# Altium project PD_BQ_Ref_Design.PrjPcb (part 2 of 3)

## Sheet BQ25792.SchDoc
size A2; Date: Not shown in title block; ApprovedBy: Not shown in title block; CheckedBy: Not shown in title block; Author: Not shown in title block; CompanyName: Not shown in title block; Engineer: Not shown in title block; Organization: Not shown in title block; Address1: Not shown in title block; Address2: Not shown in title block; Address3: Not shown in title block; Address4: Not shown in title block; DocumentNumber: 2; Revision: Use project parameter SCH_Rev; SheetNumber: 2; SheetTotal: 3; PageSetup: Record=PageOptions|CenterHorizontal=True|CenterVertical=True|PrintScale=1.00|XCorrection=1.00|YCorrection=1.00|PrintKind=0|BorderSize=5000000|LeftOffset=0|BottomOffset=0|Orientation=2|PaperLength=1000|PaperWidth=1000|Scale=100|PaperSource=15|PrintQuality=600|MediaType=1|DitherType=10|PaperKind=Letter|PrintScaleMode=1; CurrentTime: Not shown in title block; CurrentDate: Not shown in title block; Time: Not shown in title block; DocumentFullPathAndName: Not shown in title block; DocumentName: Not shown in title block; ModifiedDate: Not shown in title block; ImagePath: Not shown in title block
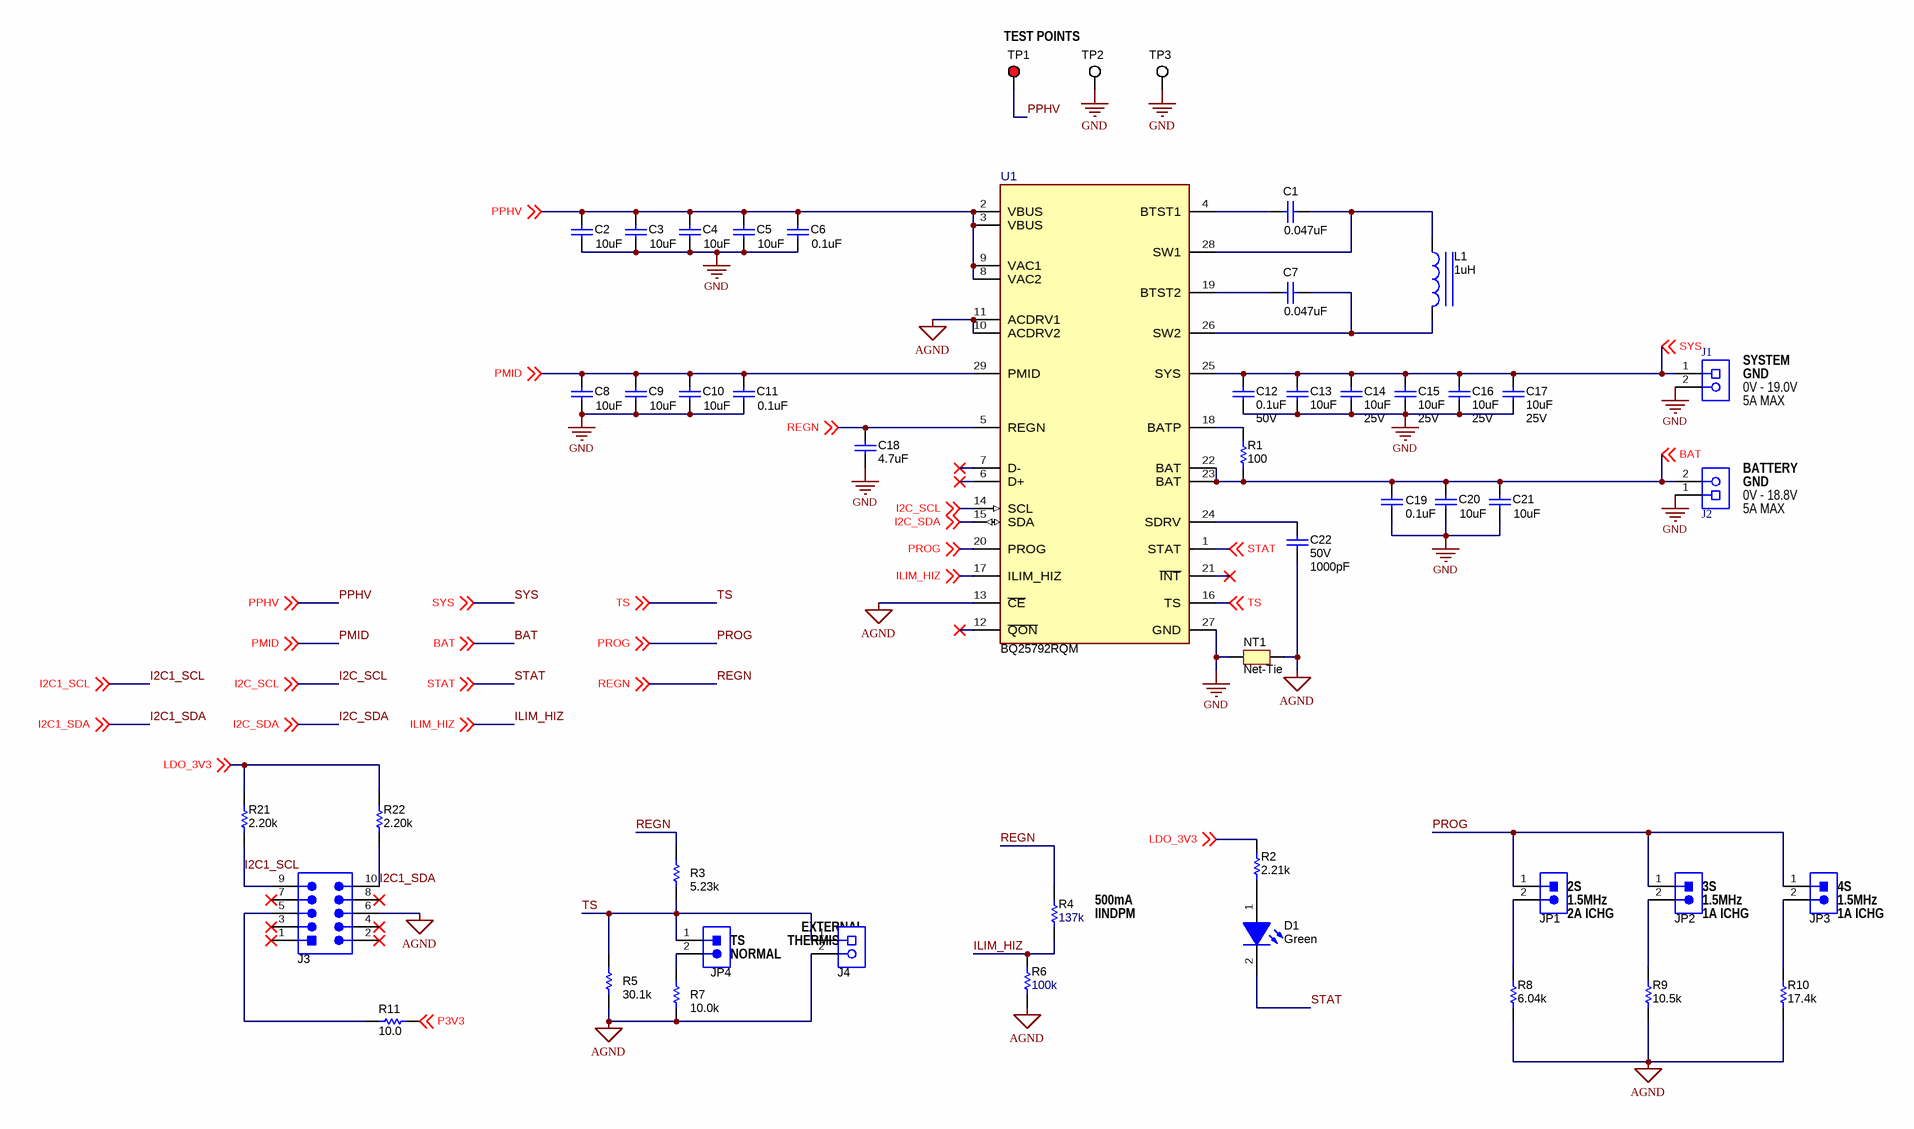
[diagram p3: BQ25792.SchDoc]

### Parts
C1  ValueDisplayed: 0.047uF  [0402]  (hidden comment: GRM155R71E473KA88D)
C2  ValueDisplayed: 10uF  [0603]  (hidden comment: GRT188R61E106ME13D)
C3  ValueDisplayed: 10uF  [0603]  (hidden comment: GRT188R61E106ME13D)
C4  ValueDisplayed: 10uF  [0603]  (hidden comment: GRT188R61E106ME13D)
C5  ValueDisplayed: 10uF  [0603]  (hidden comment: GRT188R61E106ME13D)
C6  ValueDisplayed: 0.1uF  [0402]  (hidden comment: C1005X7R1H104K050BE)
C7  ValueDisplayed: 0.047uF  [0402]  (hidden comment: GRM155R71E473KA88D)
C8  ValueDisplayed: 10uF  [0603]  (hidden comment: GRT188R61E106ME13D)
C9  ValueDisplayed: 10uF  [0603]  (hidden comment: GRT188R61E106ME13D)
C10  ValueDisplayed: 10uF  [0603]  (hidden comment: GRT188R61E106ME13D)
C11  ValueDisplayed: 0.1uF  [0402]  (hidden comment: C1005X7R1H104K050BE)
C12  ValueDisplayed: 0.1uF  VDC_V: 50V  [0402]  (hidden comment: C1005X7R1H104K050BE)
C13  ValueDisplayed: 10uF  [0805_HV]  (hidden comment: C2012X5R1E106K125AB)
C14  ValueDisplayed: 10uF  VDC_V: 25V  [0805_HV]  (hidden comment: C2012X5R1E106K125AB)
C15  ValueDisplayed: 10uF  VDC_V: 25V  [0805_HV]  (hidden comment: C2012X5R1E106K125AB)
C16  ValueDisplayed: 10uF  VDC_V: 25V  [0805_HV]  (hidden comment: C2012X5R1E106K125AB)
C17  ValueDisplayed: 10uF  VDC_V: 25V  [0805_HV]  (hidden comment: C2012X5R1E106K125AB)
C18  ValueDisplayed: 4.7uF  [0603]  (hidden comment: GRM188R61C475KAAJ)
C19  ValueDisplayed: 0.1uF  [0402L]  (hidden comment: C1005X7R1H104K050BE)
C20  ValueDisplayed: 10uF  [0603]  (hidden comment: GRT188R61E106ME13D)
C21  ValueDisplayed: 10uF  [0603]  (hidden comment: GRT188R61E106ME13D)
C22  VDC_V: 50V  ValueDisplayed: 1000pF  [0402]  (hidden comment: C0402C102K5RACTU)
D1  value Green  [LED_LTST-C190]  (hidden comment: LTST-C190GKT)
J1  ED120/2DS  [On-Shore_ED120_2DS]  (value not drawn)
J2  ED120/2DS  [On-Shore_ED120_2DS]  (value not drawn)
J3  N2510-6002-RB  [CONN_2510-6002]  (value not drawn)
J4  0393570002  [MOLEX_39357-0002]  (value not drawn)
JP1  Header_2x1  [CONN_PEC02SAAN]  (value not drawn)
JP2  Header_2x1  [CONN_PEC02SAAN]  (value not drawn)
JP3  Header_2x1  [CONN_PEC02SAAN]  (value not drawn)
JP4  Header_2x1  [CONN_PEC02SAAN]  (value not drawn)
L1  ValueDisplayed: 1uH  [IHLP-2020BZ]  (hidden comment: IHLP2020BZER1R0M11)
NT1  Net-Tie  [Net-Tie_20milWide_60milLong]  (net tie, no BOM)
R1  ValueDisplayed: 100  [0603]  (hidden comment: RC0603FR-07100RL)
R2  value 2.21k  [0402]  (hidden comment: CRCW04022K21FKED)
R3  value 5.23k  [0402]  (hidden comment: Resistor)
R4  ValueDisplayed: 137k  [0603]  (hidden comment: RC0603FR-07137KL)
R5  value 30.1k  [0402]  (hidden comment: Resistor)
R6  ValueDisplayed: 100k  [0603]  (hidden comment: RC0603FR-07100KL)
R7  value 10.0k  [0402]  (hidden comment: Resistor)
R8  ValueDisplayed: 6.04k  [0603]  (hidden comment: RC0603FR-076K04L)
R9  ValueDisplayed: 10.5k  [0603]  (hidden comment: CRCW060310K5FKEA)
R10  ValueDisplayed: 17.4k  [0603]  (hidden comment: CRCW060317K4FKEA)
R11  ValueDisplayed: 10.0  [1206]  (hidden comment: ERJ-8ENF10R0V)
R21  ValueDisplayed: 2.20k  [0201]  (hidden comment: CRCW02012K20FKED)
R22  ValueDisplayed: 2.20k  [0201]  (hidden comment: CRCW02012K20FKED)
TP1  5000  [Keystone5000]  (value not drawn)
TP2  5016  [Testpoint_Keystone_Compact]  (value not drawn)
TP3  5016  [Testpoint_Keystone_Compact]  (value not drawn)
U1  BQ25792RQM  [RQM0029A-MFG]

### Nets
AGND: C22.2 J3.6 J4.2 NT1.2 R5.1 R6.1 R7.1 R8.1 R9.1 R10.1 U1.10(ACDRV2) U1.11(ACDRV1) U1.13(~{CE})
GND: C2.1 C3.1 C4.1 C5.1 C6.2 C8.1 C9.1 C10.1 C11.2 C12.2 C13.2 C14.2 C15.2 C16.2 C17.2 C18.2 C19.2 C20.2 C21.2 J1.2 J2.1 NT1.1 TP2.1 TP3.1 U1.27(GND)
P3V3: R11.2 ; off-sheet P3V3
BAT: C19.1 C20.1 C21.1 J2.2 R1.1 U1.22(BAT) U1.23(BAT) ; off-sheet BAT
I2C1_SCL: J3.9 R21.1 ; off-sheet I2C1_SCL
I2C1_SDA: J3.10 R22.1 ; off-sheet I2C1_SDA
I2C_SCL: U1.14(SCL) ; off-sheet I2C_SCL
I2C_SDA: U1.15(SDA) ; off-sheet I2C_SDA
ILIM_HIZ: R4.1 R6.2 U1.17(ILIM_HIZ) ; off-sheet ILIM_HIZ
LDO_3V3: R2.2 R21.2 R22.2 ; off-sheet LDO_3V3
PMID: C8.2 C9.2 C10.2 C11.1 U1.29(PMID) ; off-sheet PMID
PPHV: C2.2 C3.2 C4.2 C5.2 C6.1 TP1.1 U1.2(VBUS) U1.3(VBUS) U1.8(VAC2) U1.9(VAC1) ; off-sheet PPHV
PROG: JP1.1 JP2.1 JP3.1 U1.20(PROG) ; off-sheet PROG
REGN: C18.1 R3.2 R4.2 U1.5(REGN) ; off-sheet REGN
STAT: D1.2(K) U1.1(STAT) ; off-sheet STAT
SYS: C12.1 C13.1 C14.1 C15.1 C16.1 C17.1 J1.1 U1.25(SYS) ; off-sheet SYS
TS: J4.1 JP4.1 R3.1 R5.2 U1.16(TS) ; off-sheet TS
NetC1_1: C1.1 U1.4(BTST1)
NetC1_2: C1.2 L1.1 U1.28(SW1)
NetC7_1: C7.1 U1.19(BTST2)
NetC7_2: C7.2 L1.2 U1.26(SW2)
NetC22_1: C22.1 U1.24(SDRV)
NetD1_1: D1.1(A) R2.1
NetJ3_5: J3.5 R11.1
NetJP1_2: JP1.2 R8.2
NetJP2_2: JP2.2 R9.2
NetJP3_2: JP3.2 R10.2
NetJP4_2: JP4.2 R7.2
NetR1_2: R1.2 U1.18(BATP)

Not connected (* = marked no-connect by the designer): J3 1* 2* 3* 4* 7* 8*; U1 6(D+)* 7(D-)* 12(~{QON})* 21(~{INT})*

### Notes on the sheet
- TEST POINTS
- (near J1) GND
- (near J1) 0V - 19.0V
- (near J1) 5A MAX
- (near J1) SYSTEM
- (near J2) BATTERY
- (near J2) GND
- (near J2) 0V - 18.8V
- (near J2) 5A MAX
- (near JP4) TS
- (near J4) EXTERNAL
- (near J4) THERMISTOR
- (near R4) 500mA
- (near R4) IINDPM
- (near JP1) 2S
- (near JP1) 1.5MHz
- (near JP1) 2A ICHG
- (near JP2) 3S
- (near JP2) 1.5MHz
- (near JP2) 1A ICHG
- (near JP3) 4S
- (near JP3) 1.5MHz
- (near JP3) 1A ICHG
- (near JP4) NORMAL
- (near J4) GND
- Orderable:
- Designed for:
- Mod. Date:
- Texas Instruments and/or its licensors do not warrant the accuracy or completeness of this specification or any information contained therein. Texas Instruments and/or its licensors do not warrant that this design will meet the specifications, will be suitable for your application or fit for any particular purpose, or will operate in an implementation. Texas Instruments and/or its licensors do not warrant that the design is production worthy. You should completely validate and test your design implementation to confirm the system functionality for your application.
- Drawn By:
- Engineer:
- SVN Rev:
- Number:
- TID #:
- Rev:
- Sheet Title:
- File:
- Contact:
- Project Title:
- Assembly Variant:
- Sheet:
- Size:
- of
- A2
- © Texas Instruments
- http://www.ti.com

### Library data of the parts
C1 C7 = CMP-0006669-2: CAP, CERM, 0.047 uF, 25 V, +/- 10%, X7R, 0402; Manufacturer: MuRata; TaMin_C: -55°C; Polarized: N; SizeAreaWB_mm2: 3; Value1: Unknown; U/M: EA; TaMax_C: 125°C; SizeZ_mm: 0.6; SizeX_mm: 1; SizeY_mm: 0.5; Value2: 25V; Cap_F: 47nF; AEC Category: Q200; Supplier Part Number 2: 14T3282; Publisher: Texas Instruments; Supplier 2: Newark; Supplier Part Number 3: 81-GRM155R71E473KA88; TempCo: X7R; Supplier 3: Mouser; Published: 2008-06-19; RoHS: Y; MountType: SMT; Value: 0.047uF; Supplier 1: Digi-Key; PackageReference: 0402; Tolerance_%: 10%; Cap_Case: 0402; SizeArea_mm2: 0.5; CompType: Capacitor; LatestRevisionDate: 2017-03-09; PartNumber: GRM155R71E473KA88D; AEC Qualified: ?; ComponentLink1Description: Datasheet link; Supplier Part Number 1: 490-3254-1-ND; Technology: Ceramic; ComponentLink1URL: http://search.murata.co.jp/Ceramy/PnsearchViewAction.do?HnOFG=ON&HnNFG=ON&SEL_CNT=50&sLang=en&sKey=GRM155R71E473KA88D&x=9&y=9&search=startwith
C2-C5 C8-C10 C20 C21 = CMP-0007501-5: CAP, CERM, 10 uF, 25 V, +/- 20%, X5R, 0603; Manufacturer: MuRata; TaMin_C: -55°C; Polarized: N; SizeAreaWB_mm2: 4.68; Value1: Unknown; U/M: EA; Value: 10uF; TaMax_C: 85°C; SizeZ_mm: 1; SizeX_mm: 1.6; SizeY_mm: 0.8; Value2: 25V; SizeArea_mm2: 1.28; Cap_F: 10µF; AEC Category: Q200; Supplier Part Number 2: 81-GRT188R61E106ME3D; Publisher: Texas Instruments; Supplier 2: Mouser; TempCo: X5R; Published: 2008-06-19; RoHS: Y; MountType: SMT; Supplier 1: Digi-Key; PackageReference: 0603; Tolerance_%: 20%; Cap_Case: 0603; CompType: Capacitor; LatestRevisionDate: 2017-03-09; PartNumber: GRT188R61E106ME13D; AEC Qualified: N; ComponentLink1Description: Datasheet link; AEC Grade: N/A; Supplier Part Number 1: 490-12323-1-ND; Technology: Ceramic; ComponentLink1URL: http://search.murata.co.jp/Ceramy/image/img/A01X/G101/ENG/GRT188R61E106ME13-01.pdf
C6 C11 = CMP-0064946-2: CAP, CERM, 0.1 uF, 50 V,+/- 10%, X7R, 0402; Manufacturer: TDK; TaMin_C: -55°C; Polarized: N; SizeAreaWB_mm2: 3; Value1: Unknown; U/M: EA; Value: 0.1uF; TaMax_C: 125°C; SizeZ_mm: 0.6; SizeX_mm: 1; SizeY_mm: 0.5; Value2: 50V; Cap_F: 100nF; AEC Category: Q200; Supplier Part Number 2: 92Y5763; Publisher: Texas Instruments; Supplier 2: Newark; Supplier Part Number 3: 810-C1005X7R1H104KBE; TempCo: X7R; Supplier 3: Mouser; Published: 2008-06-19; RoHS: Y; MountType: SMT; Supplier 1: Digi-Key; PackageReference: 0402; Tolerance_%: 10%; Cap_Case: 0402; SizeArea_mm2: 0.5; CompType: Capacitor; LatestRevisionDate: 2017-06-05; PartNumber: C1005X7R1H104K050BE; AEC Qualified: N; ComponentLink1Description: Datasheet link; AEC Grade: N/A; Supplier Part Number 1: 445-173610-1-ND; Technology: Ceramic; ComponentLink1URL: https://product.tdk.com/info/en/catalog/datasheets/mlcc_commercial_soft_en.pdf
C12 = CMP-0064946-2: CAP, CERM, 0.1 uF, 50 V,+/- 10%, X7R, 0402; Manufacturer: TDK; TaMin_C: -55°C; Polarized: N; SizeAreaWB_mm2: 3; Value1: Unknown; U/M: EA; Value: 0.1uF; TaMax_C: 125°C; SizeZ_mm: 0.6; SizeX_mm: 1; SizeY_mm: 0.5; Cap_F: 100nF; AEC Category: Q200; ComponentLink1URL: https://product.tdk.com/info/en/catalog/datasheets/mlcc_commercial_soft_en.pdf; Supplier Part Number 2: 92Y5763; Publisher: Texas Instruments; Supplier 2: Newark; Supplier Part Number 3: 810-C1005X7R1H104KBE; TempCo: X7R; Supplier 3: Mouser; Published: 2008-06-19; RoHS: Y; MountType: SMT; Supplier 1: Digi-Key; PackageReference: 0402; Tolerance_%: 10%; Cap_Case: 0402; Value2: 50V; SizeArea_mm2: 0.5; CompType: Capacitor; LatestRevisionDate: 2017-06-05; PartNumber: C1005X7R1H104K050BE; AEC Qualified: N; ComponentLink1Description: Datasheet link; AEC Grade: N/A; Supplier Part Number 1: 445-173610-1-ND; Technology: Ceramic
C13 = CMP-0007828-2: CAP, CERM, 10 uF, 25 V, +/- 10%, X5R, 0805; Manufacturer: TDK; TaMin_C: -55°C; Polarized: N; SizeAreaWB_mm2: 6.75; Value1: Unknown; U/M: EA; Value: 10uF; TaMax_C: 85°C; SizeZ_mm: 1.45; SizeX_mm: 2; SizeY_mm: 1.25; Cap_Case: 0805; Value2: 25V; SizeArea_mm2: 2.5; Cap_F: 10µF; AEC Category: Q200; ComponentLink1URL: http://www.tdk.com/pdf/TDKMLCCCapRange.pdf; Publisher: Texas Instruments; TempCo: X5R; Published: 2008-06-19; RoHS: Y; MountType: SMT; Supplier 1: Digi-Key; PackageReference: 0805; Tolerance_%: 10%; CompType: Capacitor; LatestRevisionDate: 2017-03-09; PartNumber: C2012X5R1E106K125AB; AEC Qualified: ?; ComponentLink1Description: Datasheet link; Supplier Part Number 1: 445-5984-1-ND; Technology: Ceramic; VDC_V: 25V
C14-C17 = CMP-0007828-2: CAP, CERM, 10 uF, 25 V, +/- 10%, X5R, 0805; Manufacturer: TDK; TaMin_C: -55°C; Polarized: N; SizeAreaWB_mm2: 6.75; Value1: Unknown; U/M: EA; Value: 10uF; TaMax_C: 85°C; SizeZ_mm: 1.45; SizeX_mm: 2; SizeY_mm: 1.25; Cap_Case: 0805; SizeArea_mm2: 2.5; Cap_F: 10µF; AEC Category: Q200; ComponentLink1URL: http://www.tdk.com/pdf/TDKMLCCCapRange.pdf; Publisher: Texas Instruments; TempCo: X5R; Published: 2008-06-19; RoHS: Y; MountType: SMT; Supplier 1: Digi-Key; PackageReference: 0805; Tolerance_%: 10%; Value2: 25V; CompType: Capacitor; LatestRevisionDate: 2017-03-09; PartNumber: C2012X5R1E106K125AB; AEC Qualified: ?; ComponentLink1Description: Datasheet link; Supplier Part Number 1: 445-5984-1-ND; Technology: Ceramic
C18 = CMP-0007341-5: CAP, CERM, 4.7 uF, 16 V, +/- 10%, X5R, 0603; Manufacturer: MuRata; TaMin_C: -55°C; Polarized: N; SizeAreaWB_mm2: 4.68; Value1: Unknown; U/M: EA; Value: 4.7uF; TaMax_C: 85°C; SizeZ_mm: 1; SizeX_mm: 1.6; SizeY_mm: 0.8; Value2: 16V; SizeArea_mm2: 1.28; Cap_F: 4.7µF; AEC Category: Q200; Supplier Part Number 2: 81-GRM188R61C475KAJD; Publisher: Texas Instruments; Supplier 2: Mouser; TempCo: X5R; Published: 2008-06-19; RoHS: Y; MountType: SMT; Supplier 1: Digi-Key; PackageReference: 0603; Tolerance_%: 10%; Cap_Case: 0603; CompType: Capacitor; LatestRevisionDate: 2017-03-09; PartNumber: GRM188R61C475KAAJ; AEC Qualified: N; ComponentLink1Description: Datasheet link; AEC Grade: N/A; Supplier Part Number 1: 490-10481-1-ND; Technology: Ceramic; ComponentLink1URL: http://psearch.murata.com/capacitor/product/GRM188R61C475KAAJ%23.pdf
C19 = CMP-0064946-2: CAP, CERM, 0.1 uF, 50 V,+/- 10%, X7R, 0402; Manufacturer: TDK; TaMin_C: -55°C; Polarized: N; SizeAreaWB_mm2: 3; Value1: Unknown; U/M: EA; Value: 0.1uF; TaMax_C: 125°C; SizeZ_mm: 0.6; SizeX_mm: 1; SizeY_mm: 0.5; Cap_Case: 0402; Value2: 50V; Cap_F: 100nF; AEC Category: Q200; Supplier Part Number 2: 92Y5763; Publisher: Texas Instruments; Supplier 2: Newark; Supplier Part Number 3: 810-C1005X7R1H104KBE; TempCo: X7R; Supplier 3: Mouser; Published: 2008-06-19; RoHS: Y; MountType: SMT; Supplier 1: Digi-Key; PackageReference: 0402; Tolerance_%: 10%; SizeArea_mm2: 0.5; CompType: Capacitor; LatestRevisionDate: 2017-06-05; PartNumber: C1005X7R1H104K050BE; AEC Qualified: N; VDC_V: 50V; ComponentLink1Description: Datasheet link; AEC Grade: N/A; Supplier Part Number 1: 445-173610-1-ND; Technology: Ceramic; ComponentLink1URL: https://product.tdk.com/info/en/catalog/datasheets/mlcc_commercial_soft_en.pdf
C22 = CMP-0006235-2: CAP, CERM, 1000 pF, 50 V, +/- 10%, X7R, 0402; Manufacturer: Kemet; TaMin_C: -55°C; Polarized: N; SizeAreaWB_mm2: 3; Value1: Unknown; U/M: EA; Value: 1000pF; TaMax_C: 125°C; SizeZ_mm: 0.6; SizeX_mm: 1; SizeY_mm: 0.5; Cap_F: 1nF; AEC Category: Q200; Supplier Part Number 2: 53M7151; Publisher: Texas Instruments; Supplier 2: Newark; Supplier Part Number 3: 80-C0402C102K5R; TempCo: X7R; Supplier 3: Mouser; Published: 2008-06-19; RoHS: Y; MountType: SMT; Supplier 1: Digi-Key; PackageReference: 0402; Tolerance_%: 10%; Cap_Case: 0402; Value2: 50V; SizeArea_mm2: 0.5; CompType: Capacitor; LatestRevisionDate: 2017-03-09; PartNumber: C0402C102K5RACTU; AEC Qualified: N; ComponentLink1Description: Datasheet link; AEC Grade: N/A; Supplier Part Number 1: 399-1032-1-ND; Technology: Ceramic; ComponentLink1URL: http://www.kemet.com/docfinder?Partnumber=C0402C102K5RACTU
D1 = CMP-0002827-3: LED, Green, SMD; Manufacturer: Lite-On; Vf_V: 2.1V; Io_A: 20mA; Power_TotalModule: 100mW; Value1: 0.1W; CompType: LED; PartNumber: LTST-C190GKT; MountType: SMT; RoHS: Y; PackageReference: 1.6x0.8x0.8mm; Type: ?; Value2: 2.1V; Color: green; ComponentLink1URL: https://sps06.itg.ti.com/sites/KMS/crossdivteams/altium/docs/ComponentDatasheets/LTST-C190GKT.pdf; ComponentLink1Description: Datasheet link
J1 J2 = CMP-0074910-1: Terminal Block, 5.08 mm, 2x1, Brass, TH; Manufacturer: On-Shore Technology; Cert_VDE: Y; CNHeader: False; Current_A: 15A; Green_Lifecycle: Not Set; Shrouded: N; Gender: Female; Green_REACh: Incomplete; Voltage_V: 300V; Row_Count: 1; Pitch_mm: 5.08; CT: True; ComponentLink1URL: http://www.on-shore.com/sites/default/files/manuals/ed120ds.pdf; Publisher: Texas Instruments; Color: Blue; Cert_CULUS: Y; RoHS: Y; MountType: TH; Green_EU RoHS-2: Incomplete; Supplier 1: Digi-Key; Green_EU RoHS: Incomplete; PackageReference: 2x1 5.08 mm Terminal Block; PinCount: 2; CompType: Terminal Block; LatestRevisionDate: 2017-07-12; PartNumber: ED120/2DS; Orientation: Vertical; ComponentLink1Description: Datasheet URL; Supplier Part Number 1: ED1609-ND; ContactFinish: Brass
J3 = CMP-0055448-2: Header (shrouded), 100mil, 5x2, High-Temperature, Gold, TH; Manufacturer: 3M; Green_Lifecycle: Active; Green_REACh: Passed; ComponentLink1URL: http://multimedia.3m.com/mws/mediawebserver?mwsId=66666UF6EVsSyXTtMXM6MxfcEVtQEVs6EVs6EVs6E666666--&fn=ts0770.pdf; Supplier Part Number 2: 18M6808; Supplier 2: Newark; Supplier Part Number 3: 517-N2510-6002RB; Supplier 3: Mouser; RoHS: Y; MountType: TH; Green_EU RoHS-2: Incomplete; Supplier 1: Digi-Key; Green_EU RoHS: Passed; PackageReference: 5x2 Shrouded header; CompType: Header; PartNumber: N2510-6002-RB; ComponentLink1Description: Datasheet URL; Supplier Part Number 1: MHC10K-ND
J4 = CMP-0055341-2: Terminal Block, 3.5 mm, 2x1, Tin, TH; Manufacturer: Molex; CNHeader: FALSE; CT: TRUE; Green_Lifecycle: Not Set; Green_REACh: Incomplete; Supplier Part Number 3: 538-39357-0002; PartNumber: 0393570002; Green_EU RoHS: Incomplete; Supplier Part Number 1: WM7877-ND; MountType: TH; Supplier 1: Digi-Key; Supplier 2: Newark; Green_EU RoHS-2: Incomplete; PackageReference: Terminal Block, 3.5 mm, 2x1, TH; CompType: Terminal Block; LatestRevisionDate: 26/05/2017; Publisher: Texas Instruments; ComponentLink1URL: http://www.molex.com/pdm_docs/sd/393570002_sd.pdf; Supplier Part Number 2: 72K2104; RoHS: Y; Supplier 3: Mouser; ComponentLink1Description: Datasheet URL
JP1-JP4 = CMP-0002337-1: Header, 100mil, 2x1, Tin, TH; PartNumber: PEC02SAAN; Manufacturer: Sullins Connector Solutions; Pitch_mm: 2.54; Gender: Male; Shrouded: N; Row_Count: 1; Current_A: 3A; Voltage_V: 1.8kV; Cert_UL: Y; CNHeader: TRUE; CT: FALSE; Green_Lifecycle: Not Set; Green_REACh: Incomplete; PackageReference: Header, 2 PIN, 100mil, Tin; CompType: Header; RoHS: Y; MountType: TH; ComponentLink1Description: Datasheet URL; ComponentLink1URL: http://www.sullinscorp.com/catalogs/77_PAGE108-109_.100_MALE_HDR.pdf; Publisher: Texas Instruments; LatestRevisionDate: 26/05/2017; Supplier 1: Digi-Key; Supplier Part Number 1: S1012E-02-ND; ClassName: Header; Orientation: Vertical; PinCount: 2; ContactFinish: Tin; Color: Black; Green_EU RoHS-2: Incomplete; Green_EU RoHS: Incomplete
L1 = CMP-0063290-1: Inductor, Shielded Drum Core, Powdered Iron, 1 uH, 7 A, 0.0181 ohm, SMD; Manufacturer: Vishay-Dale; Isat: 7A @ 20% inductance drop; Irms: 7.5A @ 40C rise; Green_Lifecycle: Active; SizeAreaWB_mm2: 53.7782; DCR_ohm: 0.0181; Green_REACh: Passed; Value: 1uH; Imax_A: 7A; SizeZ_mm: 2; SizeX_mm: 5.49; SizeY_mm: 5.18; SizeArea_mm2: 28.4382; Ind_H: 1µH; AEC Category: Q200; ComponentLink1URL: http://www.vishay.com/docs/34261/lp20bz11.pdf; Publisher: Texas Instruments; Published: 2008-06-26; RoHS: Y; Value1: 0.0181 ohm; Material: Powdered Iron; MountType: SMT; Green_EU RoHS-2: Passed; Supplier 1: Digi-Key; Green_EU RoHS: Passed; PackageReference: 5.49x2x5.18mm; Value2: 7A; CompType: Inductor; LatestRevisionDate: 2017-06-02; PartNumber: IHLP2020BZER1R0M11; AEC Qualified: ?; ComponentLink1Description: Datasheet link; Supplier Part Number 1: 541-1218-1-ND; Technology: Shielded Drum Core
NT1 = CMP-0078142-3: Single point connection between nets.; MountType: SMT; CompType: Net-Tie; Manufacturer: N/A; PackageReference: N/A; PartNumber: N/A; Library Reference: Net-Tie
R1 = CMP-0022736-4: RES, 100, 1%, 0.1 W, 0603; Manufacturer: Yageo; Power_W: 100mW; TempCo: 100 ppm/C; Value_Code: 100R; Value: 100; EIA_Code: E96; SizeX_mm: 1.6; SizeY_mm: 0.8; SizeZ_mm: 1; Value2: 0.1W; SizeArea_mm2: 1.28; AEC Qualified: N; VDC_V: 75V; AEC Category: Q200; SizeAreaWB_mm2: 4.68; ComponentLink1URL: http://www.yageo.com/pdf/Pu-RC0603_51_PbFree_L_2.pdf; Supplier Part Number 2: 603-RC0603FR-07100RL; Supplier 2: Mouser; Supplier Part Number 3: 9238360; Supplier 3: Farnell; RoHS: Y; Value1: 1%; MountType: SMT; Supplier 1: Digi-Key; PackageReference: 0603; Tolerance_%: 1%; Res_ohm: 100; CompType: Resistor; PartNumber: RC0603FR-07100RL; ComponentLink1Description: Datasheet link; Supplier Part Number 1: 311-100HRCT-ND; Technology: Thick Film; AEC Grade: N/A
R2 = CMP-0026232-2: RES, 2.21 k, 1%, 0.063 W, AEC-Q200 Grade 0, 0402; Manufacturer: Vishay-Dale; Value_Code: 2k21; Power_W: 63mW; Value2: 0.063W; VDC_V: 50V; TempCo: 100 ppm/C; EIA_Code: E96; AEC Category: Q200; AEC Grade: 0; AEC Qualified: Y; SizeArea_mm2: 0.5; SizeX_mm: 1; SizeZ_mm: 0.6; CompType: Resistor; PartNumber: CRCW04022K21FKED; PackageReference: 0402; RoHS: E; Res_ohm: 2.21k; Tolerance_%: 1%; Value1: 1%; MountType: SMT; Technology: Thick Film; ComponentLink1Description: Datasheet link; ComponentLink1URL: http://www.vishay.com/docs/20035/dcrcwe3.pdf; Supplier 1: Digi-Key; Supplier Part Number 1: 541-2.21KLCT-ND; Supplier 2: Newark; Supplier Part Number 2: 52K6795; Supplier 3: Mouser; Supplier Part Number 3: 71-CRCW0402-2.21K-E3; SizeY_mm: 0.5; ValueDisplayed: 2.21k
R3 = CMP-0026464-2: RES, 5.23 k, 1%, 0.063 W, AEC-Q200 Grade 0, 0402; PartNumber: CRCW04025K23FKED; Manufacturer: Vishay-Dale; Value_Code: 5k23; Power_W: 63mW; Value2: 0.063W; VDC_V: 50V; TempCo: 100 ppm/C; EIA_Code: E96; AEC Category: Q200; AEC Qualified: Y; AEC Grade: 0; SizeArea_mm2: 0.5; SizeX_mm: 1; SizeZ_mm: 0.6; CompType: Resistor; PackageReference: 0402; RoHS: E; Res_ohm: 5.23k; Tolerance_%: 1%; Value1: 1%; MountType: SMT; Technology: Thick Film; ComponentLink1Description: Datasheet link; ComponentLink1URL: http://www.vishay.com/docs/20035/dcrcwe3.pdf; Supplier 1: Digi-Key; Supplier Part Number 1: 541-5.23KLCT-ND; Supplier 2: Newark; Supplier Part Number 2: 52K7121; Supplier 3: Mouser; Supplier Part Number 3: 71-CRCW0402-5.23K-E3; ValueDisplayed: 5.23k; SizeY_mm: 0.5
R4 = CMP-0022788-4: RES, 137 k, 1%, 0.1 W, 0603; Manufacturer: Yageo; Power_W: 100mW; TempCo: 100 ppm/C; Value: 137k; EIA_Code: E96; SizeX_mm: 1.6; SizeY_mm: 0.8; SizeZ_mm: 1; Value2: 0.1W; SizeArea_mm2: 1.28; AEC Qualified: N; VDC_V: 75V; AEC Category: Q200; SizeAreaWB_mm2: 4.68; ComponentLink1URL: http://www.yageo.com/pdf/Pu-RC0603_51_PbFree_L_2.pdf; Supplier Part Number 2: 603-RC0603FR-07137KL; Supplier 2: Mouser; Supplier Part Number 3: 1799325; Supplier 3: Farnell; Value_Code: 137k; RoHS: Y; Value1: 1%; MountType: SMT; Supplier 1: Digi-Key; PackageReference: 0603; Tolerance_%: 1%; Res_ohm: 137k; CompType: Resistor; PartNumber: RC0603FR-07137KL; ComponentLink1Description: Datasheet link; Supplier Part Number 1: 311-137KHRCT-ND; Technology: Thick Film; AEC Grade: N/A
R5 = CMP-0026284-2: RES, 30.1 k, 1%, 0.063 W, AEC-Q200 Grade 0, 0402; PartNumber: CRCW040230K1FKED; Manufacturer: Vishay-Dale; Value_Code: 30k1; Power_W: 63mW; Value2: 0.063W; VDC_V: 50V; TempCo: 100 ppm/C; EIA_Code: E96; AEC Category: Q200; AEC Qualified: Y; AEC Grade: 0; SizeArea_mm2: 0.5; SizeX_mm: 1; SizeZ_mm: 0.6; CompType: Resistor; PackageReference: 0402; RoHS: E; Res_ohm: 30.1k; Tolerance_%: 1%; Value1: 1%; MountType: SMT; Technology: Thick Film; ComponentLink1Description: Datasheet link; ComponentLink1URL: http://www.vishay.com/docs/20035/dcrcwe3.pdf; Supplier 1: Digi-Key; Supplier Part Number 1: 541-30.1KLCT-ND; Supplier 2: Newark; Supplier Part Number 2: 52K6954; Supplier 3: Mouser; Supplier Part Number 3: 71-CRCW0402-30.1K-E3; ValueDisplayed: 30.1k; SizeY_mm: 0.5
R6 = CMP-0022735-5: RES, 100 k, 1%, 0.1 W, 0603; Manufacturer: Yageo; Power_W: 100mW; TempCo: 100 ppm/C; Value: 100k; EIA_Code: E96; SizeX_mm: 1.6; SizeY_mm: 0.8; SizeZ_mm: 1; Value2: 0.1W; SizeArea_mm2: 1.28; AEC Qualified: N; VDC_V: 75V; AEC Category: Q200; SizeAreaWB_mm2: 4.68; Supplier Part Number 2: 603-RC0603FR-07100KL; Supplier 2: Mouser; Supplier Part Number 3: 9238727; Supplier 3: Farnell; Value_Code: 100k; RoHS: Y; Value1: 1%; MountType: SMT; Supplier 1: Digi-Key; PackageReference: 0603; Tolerance_%: 1%; Res_ohm: 100k; CompType: Resistor; PartNumber: RC0603FR-07100KL; ComponentLink1Description: Datasheet link; Supplier Part Number 1: 311-100KHRCT-ND; Technology: Thick Film; ComponentLink1URL: http://www.yageo.com/pdf/Pu-RC0603_51_PbFree_L_2.pdf; AEC Grade: N/A
R7 = CMP-0025958-3: RES, 10.0 k, 1%, 0.063 W, AEC-Q200 Grade 0, 0402; PartNumber: CRCW040210K0FKED; Manufacturer: Vishay-Dale; Res_ohm: 10k; Value_Code: 10k0; Power_W: 63mW; Value2: 0.063W; VDC_V: 50V; TempCo: 100 ppm/C; EIA_Code: E96; AEC Category: Q200; AEC Qualified: Y; AEC Grade: 0; SizeArea_mm2: 0.5; SizeX_mm: 1; SizeZ_mm: 0.6; CompType: Resistor; PackageReference: 0402; RoHS: E; Tolerance_%: 1%; Value1: 1%; MountType: SMT; Technology: Thick Film; ComponentLink1Description: Datasheet link; ComponentLink1URL: http://www.vishay.com/docs/20035/dcrcwe3.pdf; Supplier 1: Digi-Key; Supplier Part Number 1: 541-10.0KLCT-ND; Supplier 2: Newark; Supplier Part Number 2: 52K6595; Supplier 3: Mouser; Supplier Part Number 3: 71-CRCW0402-10K-E3; ValueDisplayed: 10.0k; SizeY_mm: 0.5
R8 = CMP-0023246-5: RES, 6.04 k, 1%, 0.1 W, 0603; Manufacturer: Yageo; Power_W: 100mW; TempCo: 100 ppm/C; Value_Code: 6k04; Value: 6.04k; EIA_Code: E96; SizeX_mm: 1.6; SizeY_mm: 0.8; SizeZ_mm: 1; Value2: 0.1W; SizeArea_mm2: 1.28; AEC Qualified: N; VDC_V: 75V; AEC Category: Q200; SizeAreaWB_mm2: 4.68; Supplier Part Number 2: 603-RC0603FR-076K04L; Supplier 2: Mouser; Supplier Part Number 3: 9238581; Supplier 3: Farnell; RoHS: Y; Value1: 1%; MountType: SMT; Supplier 1: Digi-Key; PackageReference: 0603; Tolerance_%: 1%; Res_ohm: 6.04k; CompType: Resistor; PartNumber: RC0603FR-076K04L; ComponentLink1Description: Datasheet link; Supplier Part Number 1: 311-6.04KHRCT-ND; Technology: Thick Film; ComponentLink1URL: http://www.yageo.com/pdf/Pu-RC0603_51_PbFree_L_2.pdf; AEC Grade: N/A
R9 = CMP-0022000-4: RES, 10.5 k, 1%, 0.1 W, AEC-Q200 Grade 0, 0603; Manufacturer: Vishay-Dale; Power_W: 100mW; TempCo: 100 ppm/C; Value_Code: 10k5; Value: 10.5k; EIA_Code: E96; SizeX_mm: 1.6; SizeY_mm: 0.8; SizeZ_mm: 1; Value2: 0.1W; SizeArea_mm2: 1.28; AEC Qualified: Y; VDC_V: 75V; AEC Category: Q200; AEC Grade: 0; Supplier Part Number 2: 52K8068; Supplier 2: Newark; Supplier Part Number 3: 71-CRCW0603-10.5K-E3; Supplier 3: Mouser; RoHS: E; Value1: 1%; MountType: SMT; Supplier 1: Digi-Key; PackageReference: 0603; Tolerance_%: 1%; Res_ohm: 10.5k; CompType: Resistor; PartNumber: CRCW060310K5FKEA; ComponentLink1Description: Datasheet link; Supplier Part Number 1: 541-10.5KHCT-ND; Technology: Thick Film; ComponentLink1URL: http://www.vishay.com/docs/20035/dcrcwe3.pdf
R10 = CMP-0022089-4: RES, 17.4 k, 1%, 0.1 W, AEC-Q200 Grade 0, 0603; Manufacturer: Vishay-Dale; Power_W: 100mW; TempCo: 100 ppm/C; Value_Code: 17k4; Value: 17.4k; EIA_Code: E96; SizeX_mm: 1.6; SizeY_mm: 0.8; SizeZ_mm: 1; Value2: 0.1W; SizeArea_mm2: 1.28; AEC Qualified: Y; VDC_V: 75V; AEC Category: Q200; AEC Grade: 0; Supplier Part Number 2: 52K8186; Supplier 2: Newark; Supplier Part Number 3: 71-CRCW0603-17.4K-E3; Supplier 3: Mouser; RoHS: E; Value1: 1%; MountType: SMT; Supplier 1: Digi-Key; PackageReference: 0603; Tolerance_%: 1%; Res_ohm: 17.4k; CompType: Resistor; PartNumber: CRCW060317K4FKEA; ComponentLink1Description: Datasheet link; Supplier Part Number 1: 541-17.4KHCT-ND; Technology: Thick Film; ComponentLink1URL: http://www.vishay.com/docs/20035/dcrcwe3.pdf
R11 = CMP-0017299-3: RES, 10.0, 1%, 0.25 W, AEC-Q200 Grade 0, 1206; Manufacturer: Panasonic; Power_W: 250mW; TempCo: 100 ppm/C; Value_Code: 10R0; Value: 10.0; EIA_Code: E96; Res_ohm: 10; SizeX_mm: 3.2; SizeY_mm: 1.6; SizeZ_mm: 1.35; Value2: 0.25W; SizeArea_mm2: 5.12; AEC Qualified: Y; VDC_V: 200V; AEC Category: Q200; AEC Grade: 0; SizeAreaWB_mm2: 10.92; Supplier Part Number 2: 1748406; Supplier 2: Farnell; RoHS: Y; Value1: 1%; MountType: SMT; Supplier 1: Digi-Key; PackageReference: 1206; Tolerance_%: 1%; CompType: Resistor; PartNumber: ERJ-8ENF10R0V; ComponentLink1Description: Datasheet link; Supplier Part Number 1: P10.0FCT-ND; Technology: Thick Film; ComponentLink1URL: https://industrial.panasonic.com/cdbs/www-data/pdf/RDA0000/AOA0000C304.pdf
R21 R22 = CMP-0027272-3: RES, 2.20 k, 1%, 0.05 W, 0201; Manufacturer: Vishay-Dale; Power_W: 50mW; TempCo: 100 ppm/C; Value_Code: 2k20; Value: 2.20k; Res_ohm: 2.2k; SizeX_mm: 0.6; SizeY_mm: 0.3; SizeZ_mm: 0.26; Value2: 0.05W; SizeArea_mm2: 0.18; AEC Qualified: N; VDC_V: 30V; AEC Category: Q200; Supplier Part Number 2: 01X1849; Supplier 2: Newark; Supplier Part Number 3: 71-CRCW02012K20FKED; Supplier 3: Mouser; RoHS: E; Value1: 1%; MountType: SMT; Supplier 1: Digi-Key; PackageReference: 0201; Tolerance_%: 1%; CompType: Resistor; PartNumber: CRCW02012K20FKED; ComponentLink1Description: Datasheet link; AEC Grade: N/A; Supplier Part Number 1: 541-2.20KAABCT-ND; Technology: Thick Film; ComponentLink1URL: http://www.vishay.com/docs/20052/crcw0201e3.pdf
TP1 = CMP-0055137-1: Test Point, Miniature, Red, TH; Manufacturer: Keystone; CNHeader: FALSE; ContactFinish: Silver; CT: TRUE; Green_Lifecycle: Active; Green_REACh: Passed; PartNumber: 5000; PackageReference: Red Miniature Testpoint; CompType: Test Point; RoHS: Y; MountType: TH; ComponentLink1Description: Datasheet URL; ComponentLink1URL: http://www.keyelco.com/userAssets/file/M60-2p60.pdf; Publisher: Texas Instruments; LatestRevisionDate: 26/05/2017; Supplier 1: Digi-Key; Supplier Part Number 1: 36-5000-ND; Supplier 2: Mouser; Supplier Part Number 2: 534-5000; Color: Red; Green_EU RoHS-2: Incomplete; Green_EU RoHS: Passed
TP2 TP3 = CMP-0055153-1: Test Point, Compact, SMT; Manufacturer: Keystone; CNHeader: FALSE; CT: TRUE; Green_Lifecycle: Active; Green_REACh: Passed; PartNumber: 5016; PackageReference: Testpoint_Keystone_Compact; CompType: Test Point; RoHS: Y; MountType: SMT; ComponentLink1Description: Datasheet URL; ComponentLink1URL: http://www.keyelco.com/userAssets/store/files/5016.PDF; Publisher: Texas Instruments; LatestRevisionDate: 26/05/2017; Supplier 1: Digi-Key; Supplier Part Number 1: 36-5016TR-ND; Supplier 2: Mouser; Supplier Part Number 2: 534-5016; Green_EU RoHS-2: Incomplete; Green_EU RoHS: Passed
U1 = CMP-0088656-1: BQ2579x HotRod; Manufacturer: Texas Instruments; SizeZ_mm: 1mm; Standoff Height: 0mm; helpURL: https://upverter.com/upn/revision/94d0648e55e6c5c0/; PartNumber: BQ25792RQM; Operating Temperature Range: to; Part Number: BQ25792RQM; Datasheet Path: datasheets/IC-BQ25792RQM.pdf; PackageReference: VQFN-HR29; RoHS: UNKNOWN

## Sheet Type_C_Port.SchDoc
size A2; Date: Not shown in title block; ApprovedBy: Not shown in title block; CheckedBy: Not shown in title block; Author: Not shown in title block; CompanyName: Not shown in title block; Engineer: Not shown in title block; Organization: Not shown in title block; Address1: Not shown in title block; Address2: Not shown in title block; Address3: Not shown in title block; Address4: Not shown in title block; DocumentNumber: 2; Revision: Use project parameter SCH_Rev; SheetNumber: 2; SheetTotal: 3; PageSetup: Record=PageOptions|CenterHorizontal=True|CenterVertical=True|PrintScale=1.00|XCorrection=1.00|YCorrection=1.00|PrintKind=0|BorderSize=5000000|LeftOffset=0|BottomOffset=0|Orientation=2|PaperLength=1000|PaperWidth=1000|Scale=100|PaperSource=15|PrintQuality=600|MediaType=1|DitherType=10|PaperKind=Letter|PrintScaleMode=1; CurrentTime: Not shown in title block; CurrentDate: Not shown in title block; Time: Not shown in title block; DocumentFullPathAndName: Not shown in title block; DocumentName: Not shown in title block; ModifiedDate: Not shown in title block; ImagePath: Not shown in title block
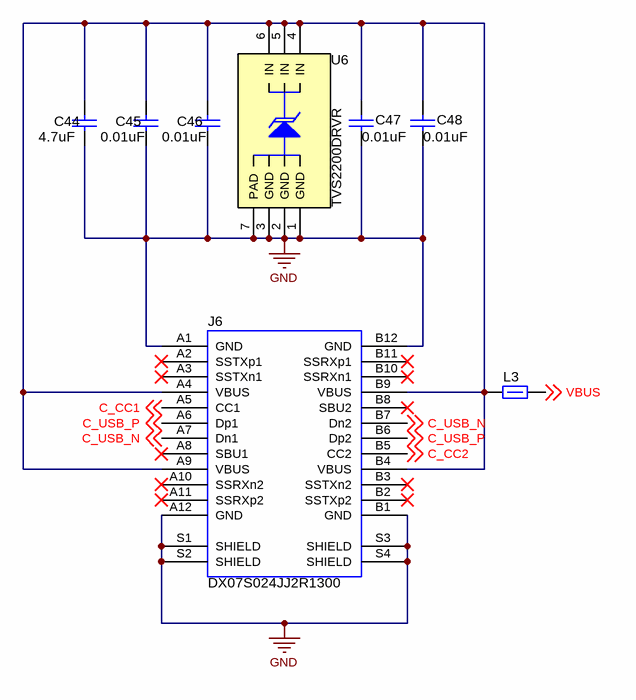
[diagram p4: Type_C_Port.SchDoc]

### Parts
C44  ValueDisplayed: 4.7uF  [0603]  (hidden comment: GRM188R6YA475KE15D)
C45  ValueDisplayed: 0.01uF  [0402]  (hidden comment: C0402C103J5RACTU)
C46  ValueDisplayed: 0.01uF  [0402]  (hidden comment: C0402C103J5RACTU)
C47  ValueDisplayed: 0.01uF  [0402]  (hidden comment: C0402C103J5RACTU)
C48  ValueDisplayed: 0.01uF  [0402]  (hidden comment: C0402C103J5RACTU)
J6  DX07S024JJ2R1300  [JAE_DX07S024JJ2R1300]
L3  FBMJ2125HM210NT  [0805_HV]  (value not drawn)
U6  TVS2200DRVR  [DRV0006A]

### Nets
GND: C44.2 C45.1 C46.1 C47.1 C48.1 J6.A1(GND) J6.A12(GND) J6.B1(GND) J6.B12(GND) J6.S1(SHIELD) J6.S2(SHIELD) J6.S3(SHIELD) J6.S4(SHIELD) U6.1(GND) U6.2(GND) U6.3(GND) U6.7(PAD)
C_CC1: J6.A5(CC1) ; off-sheet C_CC1
C_CC2: J6.B5(CC2) ; off-sheet C_CC2
C_USB_N: J6.A7(Dn1) J6.B7(Dn2) ; off-sheet C_USB_N
C_USB_P: J6.A6(Dp1) J6.B6(Dp2) ; off-sheet C_USB_P
VBUS: L3.2 ; off-sheet VBUS
NetC44_1: C44.1 C45.2 C46.2 C47.2 C48.2 J6.A4(VBUS) J6.A9(VBUS) J6.B4(VBUS) J6.B9(VBUS) L3.1 U6.4(IN) U6.5(IN) U6.6(IN)

Not connected (* = marked no-connect by the designer): J6 A2(SSTXp1)* A3(SSTXn1)* A8(SBU1)* A10(SSRXn2)* A11(SSRXp2)* B2(SSTXp2)* B3(SSTXn2)* B8(SBU2)* B10(SSRXn1)* B11(SSRXp1)*

### Notes on the sheet
- Orderable:
- Designed for:
- Mod. Date:
- Texas Instruments and/or its licensors do not warrant the accuracy or completeness of this specification or any information contained therein. Texas Instruments and/or its licensors do not warrant that this design will meet the specifications, will be suitable for your application or fit for any particular purpose, or will operate in an implementation. Texas Instruments and/or its licensors do not warrant that the design is production worthy. You should completely validate and test your design implementation to confirm the system functionality for your application.
- Drawn By:
- Engineer:
- SVN Rev:
- Number:
- TID #:
- Rev:
- Sheet Title:
- File:
- Contact:
- Project Title:
- Assembly Variant:
- Sheet:
- Size:
- of
- A2
- © Texas Instruments
- http://www.ti.com

### Library data of the parts
C44 = CMP-0007357-5: CAP, CERM, 4.7 uF, 35 V, +/- 10%, X5R, 0603; Manufacturer: MuRata; TaMin_C: -55°C; Polarized: N; SizeAreaWB_mm2: 4.68; Value1: Unknown; U/M: EA; Value: 4.7uF; TaMax_C: 85°C; SizeZ_mm: 1; SizeX_mm: 1.6; SizeY_mm: 0.8; Value2: 35V; SizeArea_mm2: 1.28; Cap_F: 4.7µF; AEC Category: Q200; Supplier Part Number 2: 68X2784; Publisher: Texas Instruments; Supplier 2: Newark; Supplier Part Number 3: 81-GRM188R6YA475KE5D; TempCo: X5R; Supplier 3: Mouser; Published: 2008-06-19; RoHS: Y; MountType: SMT; Supplier 1: Digi-Key; PackageReference: 0603; Tolerance_%: 10%; Cap_Case: 0603; CompType: Capacitor; LatestRevisionDate: 2017-03-09; PartNumber: GRM188R6YA475KE15D; AEC Qualified: ?; ComponentLink1Description: Datasheet link; Supplier Part Number 1: 490-7205-1-ND; Technology: Ceramic; ComponentLink1URL: http://psearch.murata.com/capacitor/product/GRM188R6YA475KE15%23.pdf
C45-C48 = CMP-0006236-2: CAP, CERM, 0.01 uF, 50 V, +/- 5%, X7R, 0402; Manufacturer: Kemet; TaMin_C: -55°C; Polarized: N; SizeAreaWB_mm2: 3; Value1: Unknown; U/M: EA; Value: 0.01uF; TaMax_C: 125°C; SizeZ_mm: 0.6; SizeX_mm: 1; SizeY_mm: 0.5; Value2: 50V; Cap_F: 10nF; AEC Category: Q200; Supplier Part Number 2: 57J0044; Publisher: Texas Instruments; Supplier 2: Newark; Supplier Part Number 3: 80-C0402C103J5R; TempCo: X7R; Supplier 3: Mouser; Published: 2008-06-19; RoHS: Y; MountType: SMT; Supplier 1: Digi-Key; PackageReference: 0402; Tolerance_%: 5%; Cap_Case: 0402; SizeArea_mm2: 0.5; CompType: Capacitor; LatestRevisionDate: 2017-03-09; PartNumber: C0402C103J5RACTU; AEC Qualified: ?; ComponentLink1Description: Datasheet link; Supplier Part Number 1: 399-7758-1-ND; Technology: Ceramic; ComponentLink1URL: http://www.kemet.com/Lists/ProductCatalog/Attachments/53/KEM_C1002_X7R_SMD.pdf
J6 = CMP-0085712-2: Receptacle, USB 3.1 Type C, R/A, Gold, SMT; Manufacturer: JAE Electronics; Current_A: 1.25A; Gender: Female; Voltage_V: 20V; Pitch_mm: 0.5; Row_Count: 2; ComponentLink1Description: Datasheet URL; CompType: USB; ComponentLink1URL: http://www.jae.com/z-en/pdf_download_exec.cfm?param=SJ115946.pdf; PinCount: 24; ContactFinish: Gold; PartNumber: DX07S024JJ2R1300; MountType: SMT; PackageReference: Receptacle, USB 3.1 Type C, R/A, SMT; Orientation: R/A; Color: Black; RoHS: Y
L3 = CMP-0003375-1: Ferrite Bead, 21 ohm @ 100 MHz, 6 A, 0805; Manufacturer: Taiyo Yuden; ZTyp@100MHz_Ohm: 21; SizeAreaWB_mm2: 6.75; DCR_ohm: 4m; Value1: 0.004 ohm; Value: 21 ohm; Imax_A: 6A; SizeZ_mm: 1.45; SizeX_mm: 2; SizeY_mm: 1.25; SizeArea_mm2: 2.5; ComponentLink1URL: http://www.yuden.co.jp/us/product/pdf/efbm_e.pdf; Publisher: Texas Instruments; Published: 2014-04-30; RoHS: Y; MountType: SMT; Supplier 1: Digi-Key; PackageReference: 0805; Value2: 6A; CompType: Ferrite Bead; LatestRevisionDate: 2017-03-09; PartNumber: FBMJ2125HM210NT; ComponentLink1Description: Datasheet link; Supplier Part Number 1: 587-1765-1-ND; ValueDisplayed: 21 ohm
U6 = CMP-0077834-1: 22-V Precision Surge Protection Clamp, DRV0006A (WSON-6); Alternate Manufacturer: Texas Instruments; SizeAreaWB_mm2: 9.0; SizeZ_mm: 0.8; SizeX_mm: 2.0; SizeArea_mm2: 4.0; CompType: IC; AEC Qualified: N; AEC Category: Q200; ComponentLink1URL: http://www.ti.com/lit/ds/symlink/tvs3300.pdf; PackageDescription: WSON-6; MountType: SMT; ComponentLink2URL: TBD; ComponentLink2Description: Product Folder; Manufacturer: Texas Instruments; PackageReference: DRV0006A; SizeY_mm: 2.0; PartNumber: TVS2200DRVR; ComponentLink1Description: Datasheet Link